# Altium schematic sheet POS.SchDoc
size A4; SheetNumber: 8; SheetTotal: 12
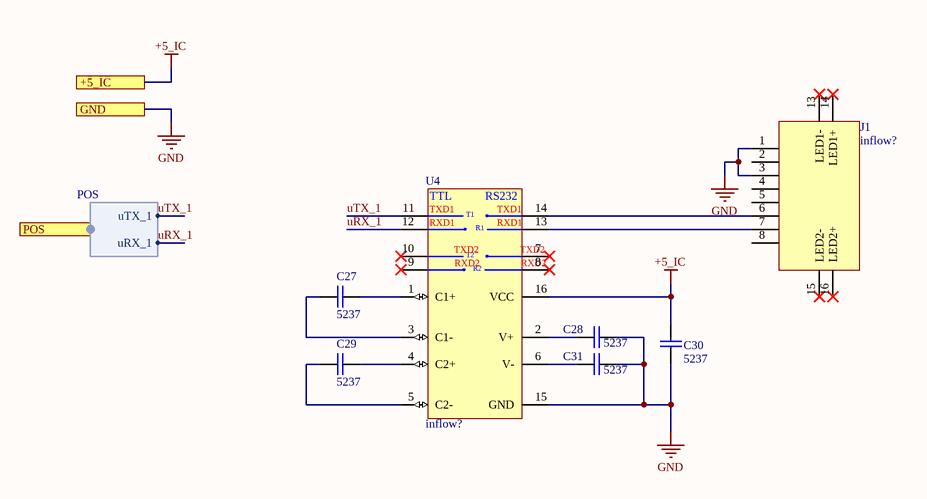
[diagram p0: POS.SchDoc]

## Parts
C27  Inflow: 5237  [CAP 1206/3216]  (hidden comment: 1u'F, 50'V)
C28  Inflow: 5237  [CAP 1206/3216]  (hidden comment: 1u'F, 50'V)
C29  Inflow: 5237  [CAP 1206/3216]  (hidden comment: 1u'F, 50'V)
C30  Inflow: 5237  [CAP 1206/3216]  (hidden comment: 1u'F, 50'V)
C31  Inflow: 5237  [CAP 1206/3216]  (hidden comment: 1u'F, 50'V)
J1  Inflow: inflow?  [RJ45_MINI]  (hidden comment: RJ45, mini)
U4  Inflow: inflow?  [NSO16_M]  (hidden comment: MAX3232)

## Ports
+5_IC, GND, POS (harness POS)

## Harnesses
POS: uTX_1, uRX_1

## Nets
+5_IC: C30.1 U4.16(VCC) ; port +5_IC
GND: C28.2 C30.2 C31.2 J1.1 J1.3 U4.15(GND) ; port GND
uRX_1: U4.12(R1OUT) ; port POS.uRX_1
uTX_1: U4.11(T1IN) ; port POS.uTX_1
NetC27_1: C27.1 U4.1(C1+)
NetC27_2: C27.2 U4.3(C1-)
NetC28_1: C28.1 U4.2(V+)
NetC29_1: C29.1 U4.4(C2+)
NetC29_2: C29.2 U4.5(C2-)
NetC31_1: C31.1 U4.6(V-)
NetJ1_6: J1.6 U4.14(T1OUT)
NetJ1_7: J1.7 U4.13(R1IN)

Not connected (* = marked no-connect by the designer): J1 2 4 5 8 13(LED1-)* 14(LED1+)* 15(LED2-)* 16(LED2+)*; U4 7(T2OUT)* 8(R2IN)* 9(R2OUT)* 10(T2IN)*

## Notes on the sheet
- (in symbol IC_Converter_MAX3232CSE) TTL; TXD1; T1; RXD1; R1; TXD2; T2; RXD2; R2

## Library data of the parts
C27-C31 = Cap_Multi_1u_50_1206: Bipolar ceramic capacitor SMD; Rating: Rating?; Type: Type?; Validation: Valid; Value: 1u'F, 50'V; Package: Package?
J1 = Con_PC_RJ45_MINI: RJ45 Mini With two LEDs; Rating: Rating?; Validation: NT; Value: RJ45, mini; Package: Package?; Type: Type?
U4 = IC_Converter_MAX3232CSE: RS-232 Interface IC 3.0V to 5.5V, Low-Power, up to 1Mbps, True RS-232 Transceivers Using Four 0.1uF External Capacitors; Rating: Rating?; Validation: Valid; Value: MAX3232; Package: SOIC-16; Type: RS232